# Altium schematic sheet top_assembly.SchDoc: Project top assembly
size A4; ApprovedBy: dr inż. Mariusz Pauluk; CompanyName: AGH University of Krakow; DrawnBy: Patryk Konieczny; DocumentNumber: ADC-SCH-01; Revision: 2.3; SheetNumber: 1; SheetTotal: 20; DocumentStatus: Released
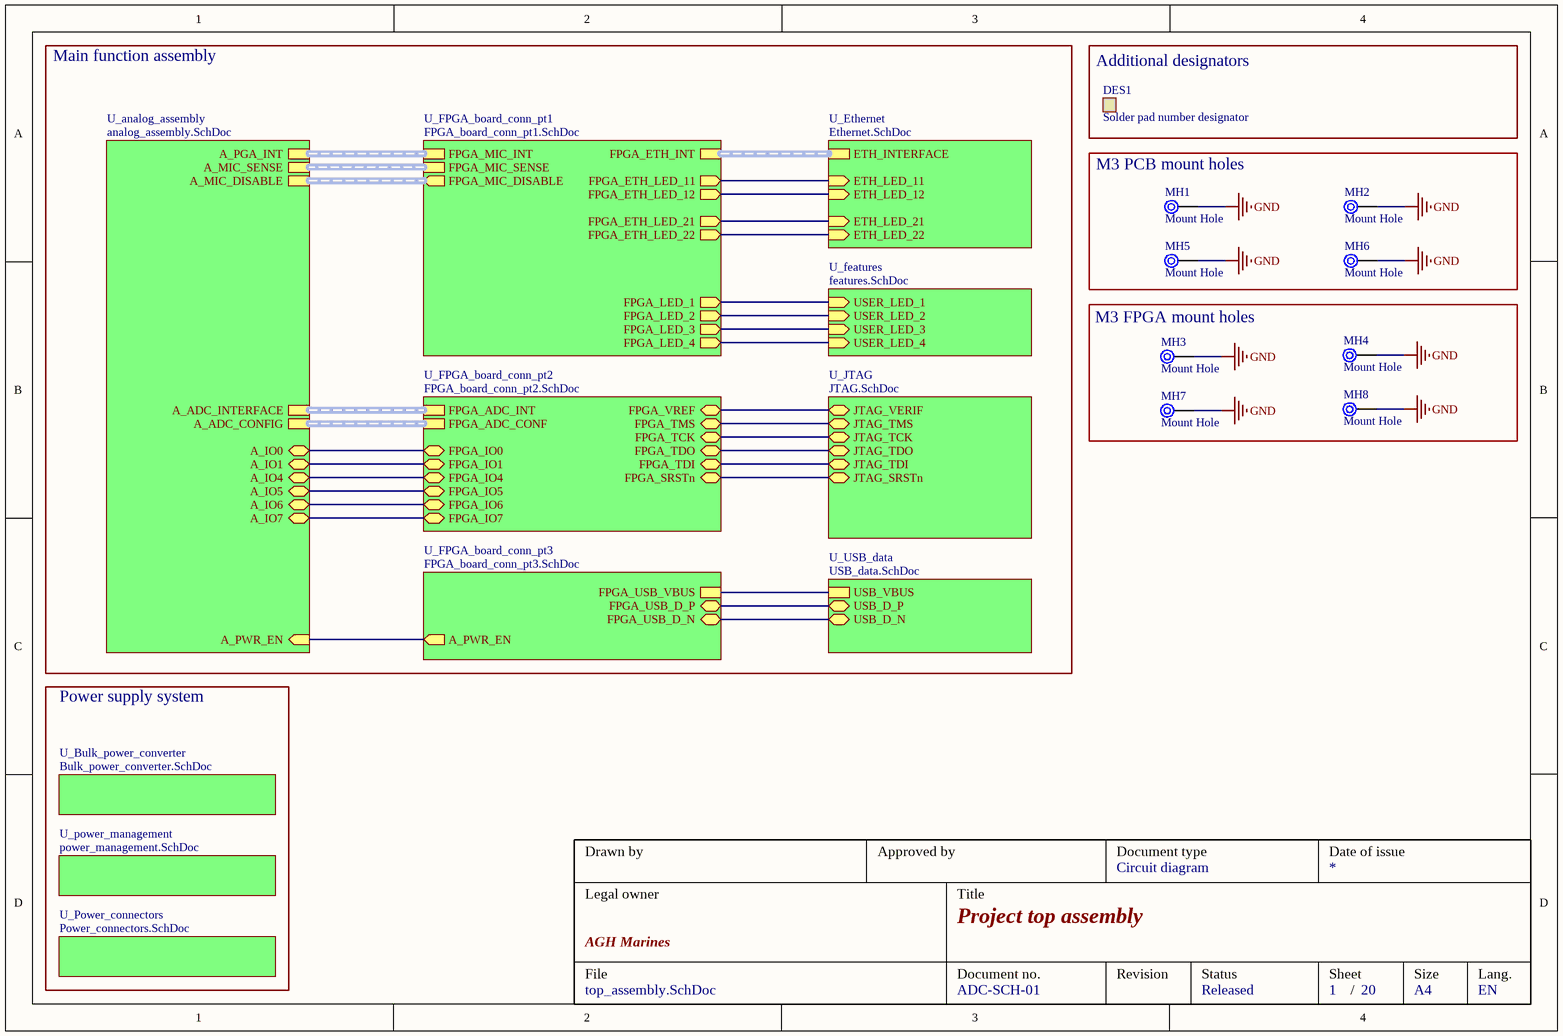
[diagram p0: top_assembly.SchDoc]

## Parts
DES1  Solder pad number designator  [DES_NUMBER]
MH1  Mount Hole  [MT_M3]
MH2  Mount Hole  [MT_M3]
MH3  Mount Hole  [MT_M3]
MH4  Mount Hole  [MT_M3]
MH5  Mount Hole  [MT_M3]
MH6  Mount Hole  [MT_M3]
MH7  Mount Hole  [MT_M3]
MH8  Mount Hole  [MT_M3]

## Blocks framed on the sheet
Additional designators: DES1
M3 PCB mount holes: MH1 MH2 MH5 MH6
M3 FPGA mount holes: MH3 MH4 MH7 MH8

## Sub-sheets
U_analog_assembly = analog_assembly.SchDoc: A_PWR_EN (in), A_MIC_SENSE (harness mic connected sense), A_MIC_DISABLE (harness mic analog disable), A_PGA_INT (harness PGA  interface), A_ADC_INTERFACE (harness ADC interface), A_ADC_CONFIG (harness ADC config), A_IO0 (bidir), A_IO1 (bidir), A_IO4 (bidir), A_IO5 (bidir), A_IO6 (bidir), A_IO7 (bidir)
U_Bulk_power_converter = Bulk_power_converter.SchDoc: no entries
U_Ethernet = Ethernet.SchDoc: ETH_LED_11 (in), ETH_LED_12 (in), ETH_LED_21 (in), ETH_LED_22 (in), ETH_INTERFACE (harness *)
U_features = features.SchDoc: USER_LED_1 (in), USER_LED_2 (in), USER_LED_3 (in), USER_LED_4 (in)
U_FPGA_board_conn_pt1 = FPGA_board_conn_pt1.SchDoc: FPGA_ETH_INT (harness ETH interface), FPGA_ETH_LED_11 (out), FPGA_ETH_LED_12 (out), FPGA_ETH_LED_21 (out), FPGA_ETH_LED_22 (out), FPGA_LED_1 (out), FPGA_LED_2 (out), FPGA_LED_3 (out), FPGA_LED_4 (out), FPGA_MIC_SENSE (harness mic connected sense), FPGA_MIC_DISABLE (out, harness mic analog disable), FPGA_MIC_INT (harness PGA  interface)
U_FPGA_board_conn_pt2 = FPGA_board_conn_pt2.SchDoc: FPGA_TCK (bidir), FPGA_TDO (bidir), FPGA_TDI (bidir), FPGA_TMS (bidir), FPGA_VREF (bidir), FPGA_SRSTn (bidir), FPGA_ADC_INT (harness ADC interface), FPGA_ADC_CONF (harness ADC config), FPGA_IO0 (bidir), FPGA_IO1 (bidir), FPGA_IO4 (bidir), FPGA_IO5 (bidir), FPGA_IO6 (bidir), FPGA_IO7 (bidir)
U_FPGA_board_conn_pt3 = FPGA_board_conn_pt3.SchDoc: FPGA_USB_VBUS, FPGA_USB_D_P (bidir), FPGA_USB_D_N (bidir), A_PWR_EN (out)
U_JTAG = JTAG.SchDoc: JTAG_VERIF (bidir), JTAG_TMS (bidir), JTAG_TCK (bidir), JTAG_TDO (bidir), JTAG_TDI (bidir), JTAG_SRSTn (bidir)
U_Power_connectors = Power_connectors.SchDoc: no entries
U_power_management = power_management.SchDoc: no entries
U_USB_data = USB_data.SchDoc: USB_VBUS, USB_D_P (bidir), USB_D_N (bidir)

## Nets
GND: MH1.1 MH2.1 MH3.1 MH4.1 MH5.1 MH6.1 MH7.1 MH8.1
(unnamed): sheet U_JTAG/JTAG_VERIF, sheet U_FPGA_board_conn_pt2/FPGA_VREF
(unnamed): sheet U_JTAG/JTAG_TMS, sheet U_FPGA_board_conn_pt2/FPGA_TMS
(unnamed): sheet U_JTAG/JTAG_TCK, sheet U_FPGA_board_conn_pt2/FPGA_TCK
(unnamed): sheet U_JTAG/JTAG_TDO, sheet U_FPGA_board_conn_pt2/FPGA_TDO
(unnamed): sheet U_JTAG/JTAG_TDI, sheet U_FPGA_board_conn_pt2/FPGA_TDI
(unnamed): sheet U_JTAG/JTAG_SRSTn, sheet U_FPGA_board_conn_pt2/FPGA_SRSTn
(unnamed): sheet U_USB_data/USB_VBUS, sheet U_FPGA_board_conn_pt3/FPGA_USB_VBUS
(unnamed): sheet U_USB_data/USB_D_P, sheet U_FPGA_board_conn_pt3/FPGA_USB_D_P
(unnamed): sheet U_USB_data/USB_D_N, sheet U_FPGA_board_conn_pt3/FPGA_USB_D_N
(unnamed): sheet U_features/USER_LED_1, sheet U_FPGA_board_conn_pt1/FPGA_LED_1
(unnamed): sheet U_features/USER_LED_2, sheet U_FPGA_board_conn_pt1/FPGA_LED_2
(unnamed): sheet U_features/USER_LED_3, sheet U_FPGA_board_conn_pt1/FPGA_LED_3
(unnamed): sheet U_features/USER_LED_4, sheet U_FPGA_board_conn_pt1/FPGA_LED_4
(unnamed): sheet U_Ethernet/ETH_LED_11, sheet U_FPGA_board_conn_pt1/FPGA_ETH_LED_11
(unnamed): sheet U_Ethernet/ETH_LED_12, sheet U_FPGA_board_conn_pt1/FPGA_ETH_LED_12
(unnamed): sheet U_Ethernet/ETH_LED_21, sheet U_FPGA_board_conn_pt1/FPGA_ETH_LED_21
(unnamed): sheet U_Ethernet/ETH_LED_22, sheet U_FPGA_board_conn_pt1/FPGA_ETH_LED_22
(unnamed): sheet U_analog_assembly/A_PWR_EN, sheet U_FPGA_board_conn_pt3/A_PWR_EN
(unnamed): sheet U_analog_assembly/A_IO0, sheet U_FPGA_board_conn_pt2/FPGA_IO0
(unnamed): sheet U_analog_assembly/A_IO1, sheet U_FPGA_board_conn_pt2/FPGA_IO1
(unnamed): sheet U_analog_assembly/A_IO4, sheet U_FPGA_board_conn_pt2/FPGA_IO4
(unnamed): sheet U_analog_assembly/A_IO5, sheet U_FPGA_board_conn_pt2/FPGA_IO5
(unnamed): sheet U_analog_assembly/A_IO6, sheet U_FPGA_board_conn_pt2/FPGA_IO6
(unnamed): sheet U_analog_assembly/A_IO7, sheet U_FPGA_board_conn_pt2/FPGA_IO7

## Buses and harness runs
harness sheet U_analog_assembly/A_ADC_CONFIG = sheet U_FPGA_board_conn_pt2/FPGA_ADC_CONF
harness sheet U_analog_assembly/A_ADC_INTERFACE = sheet U_FPGA_board_conn_pt2/FPGA_ADC_INT
harness sheet U_analog_assembly/A_MIC_DISABLE = sheet U_FPGA_board_conn_pt1/FPGA_MIC_DISABLE
harness sheet U_analog_assembly/A_MIC_SENSE = sheet U_FPGA_board_conn_pt1/FPGA_MIC_SENSE
harness sheet U_analog_assembly/A_PGA_INT = sheet U_FPGA_board_conn_pt1/FPGA_MIC_INT
harness sheet U_Ethernet/ETH_INTERFACE = sheet U_FPGA_board_conn_pt1/FPGA_ETH_INT

## Notes on the sheet
- Main function assembly
- Power supply system
- Drawn by
- Approved by
- Document type
- Date of issue
- Legal owner
- Title
- Circuit diagram
- File
- AGH Marines
- Document no.
- Revision
- Status
- Sheet
- Size
- Lang.
- /
- A4
- EN

## Library data of the parts
MH1-MH8 = MH